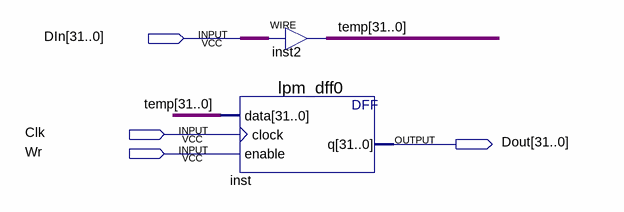
[diagram p0: schematic sheet]
// Quartus schematic Ex1.bdf as structural Verilog: 2 symbols, 4 pins
module Ex1 (
  input  [31:0] DIn,
  input  Clk,
  input  Wr,
  output [31:0] Dout
);

  wire [31:0] temp;

  assign temp = DIn;  // WIRE inst2
  lpm_dff0 inst (.data(temp), .clock(Clk), .enable(Wr), .q(Dout));
endmodule
